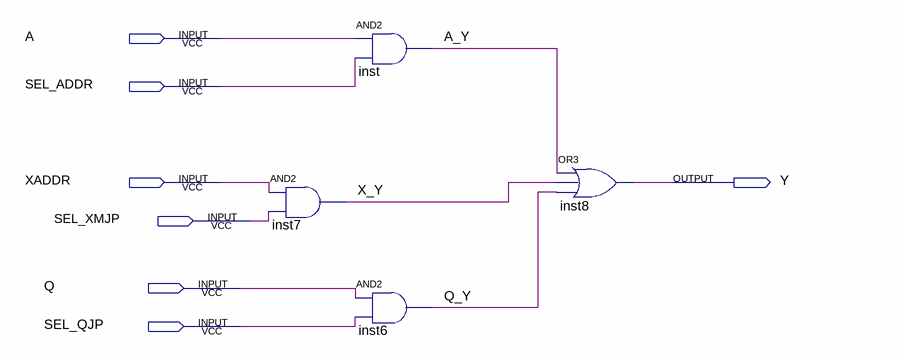
[diagram p0: schematic sheet]
// Quartus schematic next.bdf as structural Verilog: 4 symbols, 7 pins
module next (
  input  A,
  input  SEL_ADDR,
  input  XADDR,
  input  SEL_XMJP,
  input  Q,
  input  SEL_QJP,
  output Y
);

  wire A_Y, Q_Y, X_Y;

  and inst7 (X_Y, XADDR, SEL_XMJP);
  and inst (A_Y, A, SEL_ADDR);
  and inst6 (Q_Y, Q, SEL_QJP);
  or inst8 (Y, A_Y, X_Y, Q_Y);
endmodule
